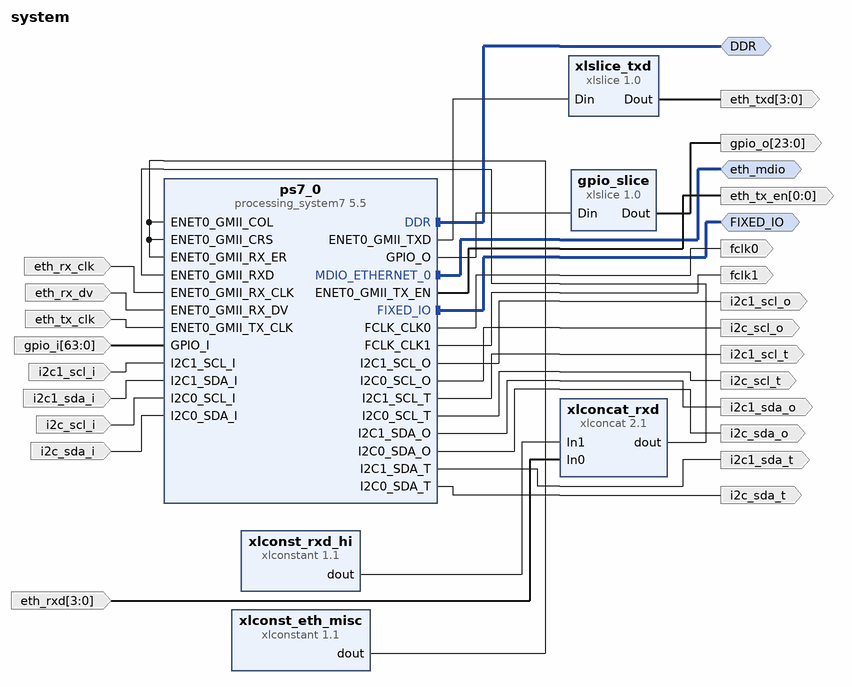
[diagram p0: block diagram of the top level]
# Vivado block design system, xc7z010clg400-1, Vivado 2025.2
create_bd_design system

create_bd_intf_port -mode Master -vlnv xilinx.com:interface:ddrx_rtl:1.0 DDR
create_bd_intf_port -mode Master -vlnv xilinx.com:display_processing_system7:fixedio_rtl:1.0 FIXED_IO
create_bd_intf_port -mode Master -vlnv xilinx.com:interface:mdio_rtl:1.0 eth_mdio
create_bd_port -dir O -type clk fclk0
create_bd_port -dir O -type clk fclk1
create_bd_port -dir O -from 23 -to 0 gpio_o
create_bd_port -dir I -from 63 -to 0 gpio_i
create_bd_port -dir I eth_rx_clk
create_bd_port -dir I -from 3 -to 0 eth_rxd
create_bd_port -dir I eth_rx_dv
create_bd_port -dir I eth_tx_clk
create_bd_port -dir O -from 0 -to 0 eth_tx_en
create_bd_port -dir O -from 3 -to 0 eth_txd
create_bd_port -dir I i2c_scl_i
create_bd_port -dir O i2c_scl_o
create_bd_port -dir O i2c_scl_t
create_bd_port -dir I i2c_sda_i
create_bd_port -dir O i2c_sda_o
create_bd_port -dir O i2c_sda_t
create_bd_port -dir I i2c1_scl_i
create_bd_port -dir O i2c1_scl_o
create_bd_port -dir O i2c1_scl_t
create_bd_port -dir I i2c1_sda_i
create_bd_port -dir O i2c1_sda_o
create_bd_port -dir O i2c1_sda_t

create_bd_cell -type ip -vlnv xilinx.com:ip:processing_system7:5.5 ps7_0
set_property -dict [list \
  CONFIG.PCW_ENET0_ENET0_IO EMIO \
  CONFIG.PCW_ENET0_GRP_MDIO_ENABLE 1 \
  CONFIG.PCW_ENET0_GRP_MDIO_IO EMIO \
  CONFIG.PCW_ENET0_PERIPHERAL_ENABLE 1 \
  CONFIG.PCW_ENET0_PERIPHERAL_FREQMHZ {100 Mbps} \
  CONFIG.PCW_EN_CLK1_PORT 1 \
  CONFIG.PCW_FCLK_CLK1_BUF TRUE \
  CONFIG.PCW_FPGA0_PERIPHERAL_FREQMHZ 200 \
  CONFIG.PCW_FPGA1_PERIPHERAL_FREQMHZ 25 \
  CONFIG.PCW_FPGA_FCLK1_ENABLE 1 \
  CONFIG.PCW_GPIO_EMIO_GPIO_ENABLE 1 \
  CONFIG.PCW_GPIO_EMIO_GPIO_IO EMIO \
  CONFIG.PCW_I2C0_I2C0_IO EMIO \
  CONFIG.PCW_I2C0_PERIPHERAL_ENABLE 1 \
  CONFIG.PCW_I2C1_I2C1_IO EMIO \
  CONFIG.PCW_I2C1_PERIPHERAL_ENABLE 1 \
  CONFIG.PCW_I2C_PERIPHERAL_FREQMHZ 111.111115 \
  CONFIG.PCW_SD0_GRP_CD_ENABLE 0 \
  CONFIG.PCW_SD0_GRP_WP_ENABLE 0 \
  CONFIG.PCW_SD0_PERIPHERAL_ENABLE 1 \
  CONFIG.PCW_SD0_SD0_IO {MIO 40 .. 45} \
  CONFIG.PCW_SDIO_PERIPHERAL_FREQMHZ 100 \
  CONFIG.PCW_UART1_PERIPHERAL_ENABLE 1 \
  CONFIG.PCW_UART1_UART1_IO {MIO 24 .. 25} \
  CONFIG.PCW_UART_PERIPHERAL_FREQMHZ 100 \
  CONFIG.PCW_UIPARAM_DDR_BUS_WIDTH {16 Bit} \
  CONFIG.PCW_UIPARAM_DDR_PARTNO {MT41K128M16 JT-125} \
  CONFIG.PCW_USE_M_AXI_GP0 0 \
] [get_bd_cells ps7_0]
# 71 more settings of ps7_0 are not shown: defaults, MIO pin electricals, DDR timing, and values the tool derives
create_bd_cell -type ip -vlnv xilinx.com:ip:xlslice:1.0 gpio_slice
set_property -dict {CONFIG.DIN_FROM 23 CONFIG.DIN_TO 0 CONFIG.DIN_WIDTH 64 CONFIG.DOUT_WIDTH 24} [get_bd_cells gpio_slice]
create_bd_cell -type ip -vlnv xilinx.com:ip:xlconstant:1.1 xlconst_rxd_hi
set_property -dict {CONFIG.CONST_VAL 0 CONFIG.CONST_WIDTH 4} [get_bd_cells xlconst_rxd_hi]
create_bd_cell -type ip -vlnv xilinx.com:ip:xlconcat:2.1 xlconcat_rxd
set_property -dict {CONFIG.IN0_WIDTH 4 CONFIG.IN1_WIDTH 4 CONFIG.NUM_PORTS 2} [get_bd_cells xlconcat_rxd]
create_bd_cell -type ip -vlnv xilinx.com:ip:xlslice:1.0 xlslice_txd
set_property -dict {CONFIG.DIN_FROM 3 CONFIG.DIN_TO 0 CONFIG.DIN_WIDTH 8 CONFIG.DOUT_WIDTH 4} [get_bd_cells xlslice_txd]
create_bd_cell -type ip -vlnv xilinx.com:ip:xlconstant:1.1 xlconst_eth_misc
set_property -dict {CONFIG.CONST_VAL 0 CONFIG.CONST_WIDTH 1} [get_bd_cells xlconst_eth_misc]

# ---- connections ----

connect_bd_intf_net [get_bd_intf_ports DDR] [get_bd_intf_pins ps7_0/DDR]
connect_bd_intf_net [get_bd_intf_ports FIXED_IO] [get_bd_intf_pins ps7_0/FIXED_IO]
connect_bd_intf_net [get_bd_intf_ports eth_mdio] [get_bd_intf_pins ps7_0/MDIO_ETHERNET_0]
connect_bd_net [get_bd_ports eth_rx_clk] [get_bd_pins ps7_0/ENET0_GMII_RX_CLK]
connect_bd_net [get_bd_ports eth_rx_dv] [get_bd_pins ps7_0/ENET0_GMII_RX_DV]
connect_bd_net [get_bd_ports eth_rxd] [get_bd_pins xlconcat_rxd/In0]
connect_bd_net [get_bd_ports eth_tx_clk] [get_bd_pins ps7_0/ENET0_GMII_TX_CLK]
connect_bd_net [get_bd_ports gpio_i] [get_bd_pins ps7_0/GPIO_I]
connect_bd_net [get_bd_pins gpio_slice/Dout] [get_bd_ports gpio_o]
connect_bd_net [get_bd_ports i2c1_scl_i] [get_bd_pins ps7_0/I2C1_SCL_I]
connect_bd_net [get_bd_ports i2c1_sda_i] [get_bd_pins ps7_0/I2C1_SDA_I]
connect_bd_net [get_bd_ports i2c_scl_i] [get_bd_pins ps7_0/I2C0_SCL_I]
connect_bd_net [get_bd_ports i2c_sda_i] [get_bd_pins ps7_0/I2C0_SDA_I]
connect_bd_net [get_bd_pins ps7_0/ENET0_GMII_TXD] [get_bd_pins xlslice_txd/Din]
connect_bd_net [get_bd_pins ps7_0/ENET0_GMII_TX_EN] [get_bd_ports eth_tx_en]
connect_bd_net [get_bd_pins ps7_0/FCLK_CLK0] [get_bd_ports fclk0]
connect_bd_net [get_bd_pins ps7_0/FCLK_CLK1] [get_bd_ports fclk1]
connect_bd_net [get_bd_pins ps7_0/GPIO_O] [get_bd_pins gpio_slice/Din]
connect_bd_net [get_bd_pins ps7_0/I2C0_SCL_O] [get_bd_ports i2c_scl_o]
connect_bd_net [get_bd_pins ps7_0/I2C0_SCL_T] [get_bd_ports i2c_scl_t]
connect_bd_net [get_bd_pins ps7_0/I2C0_SDA_O] [get_bd_ports i2c_sda_o]
connect_bd_net [get_bd_pins ps7_0/I2C0_SDA_T] [get_bd_ports i2c_sda_t]
connect_bd_net [get_bd_pins ps7_0/I2C1_SCL_O] [get_bd_ports i2c1_scl_o]
connect_bd_net [get_bd_pins ps7_0/I2C1_SCL_T] [get_bd_ports i2c1_scl_t]
connect_bd_net [get_bd_pins ps7_0/I2C1_SDA_O] [get_bd_ports i2c1_sda_o]
connect_bd_net [get_bd_pins ps7_0/I2C1_SDA_T] [get_bd_ports i2c1_sda_t]
connect_bd_net [get_bd_pins xlconcat_rxd/dout] [get_bd_pins ps7_0/ENET0_GMII_RXD]
connect_bd_net [get_bd_pins xlconst_eth_misc/dout] \
  [get_bd_pins ps7_0/ENET0_GMII_COL] [get_bd_pins ps7_0/ENET0_GMII_CRS] [get_bd_pins ps7_0/ENET0_GMII_RX_ER]
connect_bd_net [get_bd_pins xlconst_rxd_hi/dout] [get_bd_pins xlconcat_rxd/In1]
connect_bd_net [get_bd_pins xlslice_txd/Dout] [get_bd_ports eth_txd]

validate_bd_design
save_bd_design
